# Altium project PCB_Smart_Climate_Monitor.PrjPcb
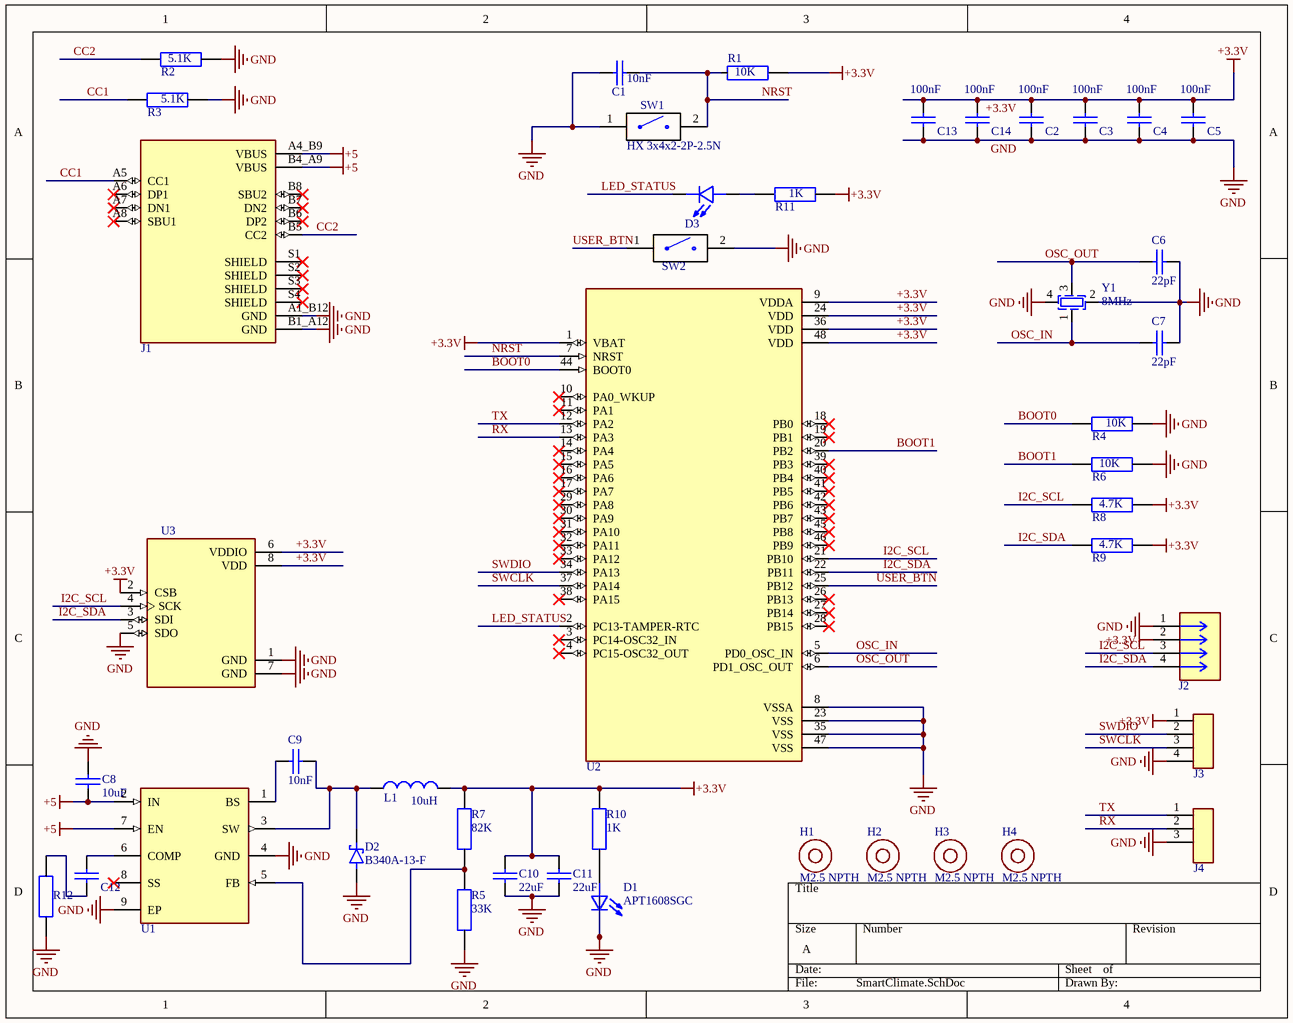
[diagram p0: SmartClimate.SchDoc]
Interface: I2C, UART, SWD; Layers: 2; Size: 50x35; V_IN: 5V or 3.7V
1 sheet, 44 parts. Net scope: global (net labels, ports and power ports of the same name join across sheets).
Board file: PCB1.PcbDoc

## Sheet SmartClimate.SchDoc
size A; SheetNumber: 1; SheetTotal: 1

### Parts
C1  10nF  [CAPC1608X95N]
C2  100nF  [CAPC1608X95N]
C3  100nF  [CAPC1608X95N]
C4  100nF  [CAPC1608X95N]
C5  100nF  [CAPC1608X95N]
C6  22pF  [CAPC1608X90]
C7  22pF  [CAPC1608X90]
C8  10uF  [CAPC2012X88N]
C9  10nF  [CAPC1608X95N]
C10  22uF  [CAPC2012X88N]
C11  22uF  [CAPC2012X88N]
C12  3.9nF  [CAPC1608X95N]  (value not drawn)
C13  100nF  [CAPC1608X95N]
C14  100nF  [CAPC1608X95N]
D1  APT1608SGC  [LED_APT1608SGC]
D2  B340A-13-F  [D_SMA_DO214AC]
D3  D_LED_Red_0603  [LED_APT1608SGC]  (value not drawn)
H1  M2.5 NPTH  [MH_M2_5_D2_7_NPTH]
H2  M2.5 NPTH  [MH_M2_5_D2_7_NPTH]
H3  M2.5 NPTH  [MH_M2_5_D2_7_NPTH]
H4  M2.5 NPTH  [MH_M2_5_D2_7_NPTH]
J1  J_USB-C_TYPE-C-31-M-12  [HRO_TYPE-C-31-M-12]  (value not drawn)
J2  J_SM04B-SRSS-TB  [CONN_SM04B-SRSS-TB_JST]  (value not drawn)
J3  J_Header_1x04_2.54mm_THT  [HDR_1x04_P2.54_THT]  (value not drawn)
J4  J_Header_1x03_2.54mm_THT  [HDR_1x03_P2.54_THT]  (value not drawn)
L1  10uH  [L_XGL5050]
R1  10K  [RESC1608X55N_10K]
R2  5.1K  [RESC1608X55N_10K]
R3  5.1K  [RESC1608X55N_10K]
R4  10K  [RESC1608X55N_10K]
R5  33K  [RESC1608X55N_10K]
R6  10K  [RESC1608X55N_10K]
R7  82K  [RESC1608X55N_10K]
R8  4.7K  [RESC1608X55N_10K]
R9  4.7K  [RESC1608X55N_10K]
R10  1K  [RESC1608X55N_10K]
R11  1K  [RESC1608X55N_10K]
R12  6.8K  [RESC1608X55N]  (value not drawn)
SW1  HX 3x4x2-2P-2.5N  [SW_HX_3x4x2_2P]
SW2  SW_SPST_3x4x2mm  [SW_HX_3x4x2_2P]  (value not drawn)
U1  U_MP2307DN-LF-Z  [SOIC127P600X170-9N]  (value not drawn)
U2  U_STM32F103C8T6  [QFP50P900X900X160-48N]  (value not drawn)
U3  U_BME280  [PSON65P250X250X100-8N]  (value not drawn)
Y1  8MHz  [XTAL_ECX32_3225_4P]

### Nets
+3.3V: C2.1 C3.1 C4.1 C5.1 C10.2 C11.2 C13.1 C14.1 J2.2 J3.1 L1.2 R1.1 R7.1 R8.1 R9.1 R10.1 R11.2 U2.1(VBAT) U2.9(VDDA) U2.24(VDD) U2.36(VDD) U2.48(VDD) U3.2(CSB) U3.6(VDDIO) U3.8(VDD)
+5: C8.1 J1.A4_B9(VBUS) J1.B4_A9(VBUS) U1.2(IN) U1.7(EN)
GND: C1.1 C2.2 C3.2 C4.2 C5.2 C6.2 C7.1 C8.2 C10.1 C11.1 C13.2 C14.2 D1.1(C) D2.2(A) J1.A1_B12(GND) J1.B1_A12(GND) J2.1 J3.4 J4.3 R2.2 R3.2 R4.2 R5.2 R6.2 R12.1 SW1.1 SW2.2 U1.4(GND) U1.9(EP) U2.8(VSSA) U2.23(VSS) U2.35(VSS) U2.47(VSS) U3.1(GND) U3.5(SDO) U3.7(GND) Y1.2 Y1.4
BOOT0: R4.1 U2.44(BOOT0)
BOOT1: R6.1 U2.20(PB2)
CC1: J1.A5(CC1) R3.1
CC2: J1.B5(CC2) R2.1
I2C_SCL: J2.3 R8.2 U2.21(PB10) U3.4(SCK)
I2C_SDA: J2.4 R9.2 U2.22(PB11) U3.3(SDI)
LED_STATUS: D3.1(C) U2.2(PC13-TAMPER-RTC)
NRST: C1.2 R1.2 SW1.2 U2.7(NRST)
OSC_IN: C7.2 U2.5(PD0_OSC_IN) Y1.1
OSC_OUT: C6.1 U2.6(PD1_OSC_OUT) Y1.3
RX: J4.2 U2.13(PA3)
SWCLK: J3.3 U2.37(PA14)
SWDIO: J3.2 U2.34(PA13)
TX: J4.1 U2.12(PA2)
USER_BTN: SW2.1 U2.25(PB12)
NetC9_1: C9.1 D2.1(K) L1.1 U1.3(SW)
NetC9_2: C9.2 U1.1(BS)
NetC12_1: C12.1 R12.2
NetC12_2: C12.2 U1.6(COMP)
NetD1_2: D1.2(A) R10.2
NetD3_2: D3.2(A) R11.1
NetR5_1: R5.1 R7.2 U1.5(FB)

Not connected (* = marked no-connect by the designer): J1 A6(DP1)* A7(DN1)* A8(SBU1)* B6(DP2)* B7(DN2)* B8(SBU2)* S1(SHIELD)* S2(SHIELD)* S3(SHIELD)* S4(SHIELD)*; U1 8(SS)*; U2 3(PC14-OSC32_IN)* 4(PC15-OSC32_OUT)* 10(PA0_WKUP)* 11(PA1)* 14(PA4)* 15(PA5)* 16(PA6)* 17(PA7)* 18(PB0)* 19(PB1)* 26(PB13)* 27(PB14)* 28(PB15)* 29(PA8)* 30(PA9)* 31(PA10)* 32(PA11)* 33(PA12)* 38(PA15)* 39(PB3)* 40(PB4)* 41(PB5)* 42(PB6)* 43(PB7)* 45(PB8)* 46(PB9)*

### Library data of the parts
C1 C9 = C_10nF_5%_50V_0603: 10nF +/-5% 50V X7R ceramic capacitor 0603; BOM References: C3; Tolerance: 5%; MP: C0603X103J5RECAUTO; MF: KEMET; Value: 10nF; Package: 0603; Capacitance: 10nF; Voltage: 50V; Dielectric: X7R; Datasheet: https://search.kemet.com/component-documentation/download/specsheet/C0603X103J5RECAUTO
C2-C5 C13 C14 = C_100nF_10%_16V_0603: 100nF +/-10% 16V X7R ceramic capacitor 0603; BOM References: C4-C8; Tolerance: 10%; MP: C0603C104K4RACTU; MF: KEMET; Value: 100nF; Package: 0603; Capacitance: 100nF; Voltage: 16V; Dielectric: X7R; Datasheet: https://search.kemet.com/component-documentation/download/specsheet/C0603C104K4RACTU
C6 C7 = C_22pF_2%_50V_0603: 22pF +/-2% 50V C0G ceramic capacitor 0603; BOM References: C9,C10; Tolerance: 2%; MP: CC0603GRNPO9BN220; MF: Yageo; Value: 22pF; Package: 0603; Capacitance: 22pF; Voltage: 50V; Dielectric: C0G; Datasheet: https://www.yageogroup.com/component-documentation/download/specsheet/CC0603GRNPO9BN220
C8 = C_10uF_10%_25V_0805: 10uF +/-10% 25V X5R ceramic capacitor 0805; BOM References: C1,C2; Tolerance: 10%; MP: C0805C106K3PACTU; MF: KEMET; Value: 10uF; Package: 0805; Capacitance: 10uF; Voltage: 25V; Dielectric: X5R; Datasheet: https://search.kemet.com/component-documentation/download/specsheet/C0805C106K3PACTU
C10 C11 = C_22uF_20%_10V_0805: 22uF 20% 10V X5R ceramic capacitor 0805; MP: C2012X5R1A226M125AB; MF: TDK; Value: 22uF; Package: 0805; Capacitance: 22uF; Tolerance: 20%; Voltage: 10V; Dielectric: X5R; Datasheet: https://product.tdk.com/en/search/capacitor/ceramic/mlcc/info?part_no=C2012X5R1A226M125AB
C12 = C_3n9_5%_50V_0603: 3.9nF 5% 50V C0G ceramic capacitor 0603; MP: C1608C0G1H392J080AA; MF: TDK; Value: 3.9nF; Package: 0603; Capacitance: 3.9nF; Tolerance: 5%; Voltage: 50V; Dielectric: C0G; Datasheet: https://product.tdk.com/en/search/capacitor/ceramic/mlcc/info?part_no=C1608C0G1H392J080AA
D1 = D_LED_Green_0603: Green LED, 0603 (1608 metric); BOM References: LED1; MF: Kingbright; Value: APT1608SGC; Package: 0603 (1608 Metric); MP: APT1608SGC; Color: Green; Datasheet: https://www.kingbrightusa.com/images/catalog/spec/APT1608SGC.pdf
D2 = D_Schottky_40V_3A_SMA: B340A-13-F Schottky rectifier, 40V 3A, SMA DO-214AC; cathode pin1, anode pin2; BOM References: D1; MF: Diodes Incorporated; Value: B340A-13-F; Package: SMA DO-214AC; MP: B340A-13-F; Voltage: 40V; Current: 3A; Datasheet: https://www.diodes.com/part/view/B340A
D3 = D_LED_Red_0603: Red LED, 0603 (1608 metric); Value: APT1608SURCK; BOM References: LED2,LED3; MF: Kingbright; Package: 0603 (1608 Metric); MP: APT1608SURCK; Color: Red; Datasheet: https://www.kingbrightusa.com/images/catalog/spec/apt1608surck.pdf
H1-H4 = H_MountingHole_M2_5_NPTH: Mechanical mounting hole M2.5, 2.7mm NPTH; Screw head clearance: 5.5 mm; Mechanical 15 outline; Hole diameter: 2.7 mm
J1 = J_USB-C_TYPE-C-31-M-12: TYPE-C-31-M-12 USB Type-C USB2.0 receptacle, 16 contacts; BOM References: J1; MF: Korean Hroparts Elec; Value: TYPE-C-31-M-12; Package: SMD top mount; MP: TYPE-C-31-M-12; LCSC: C165948; Datasheet: https://datasheet.lcsc.com/lcsc/1903211732_Korean-Hroparts-Elec-TYPE-C-31-M-12_C165948.pdf
J2 = J_SM04B-SRSS-TB: JST SH 4-position 1.0mm right-angle side-entry SMT connector; BOM References: J2; Value: SM04B-SRSS-TB; Package: JST SH 1x4 1.0mm SMT; MP: SM04B-SRSS-TB; MF: JST; Pitch: 1.0mm; Datasheet: https://www.jst-mfg.com/product/pdf/eng/eSH.pdf
J3 = J_Header_1x04_2.54mm_THT: Pin header 1x4, 2.54mm pitch, vertical through hole; Value: TSW-104-07-G-S; BOM References: J3; MF: Samtec; Package: 1x4 P2.54 THT; Pitch: 2.54mm; MP: TSW-104-07-G-S; Number of Pins: 4; Datasheet: https://suddendocs.samtec.com/prints/tsw-xxx-xx-x-x-xx-xxx-footprint.pdf
J4 = J_Header_1x03_2.54mm_THT: Pin header 1x3, 2.54mm pitch, vertical through hole; Value: TSW-103-07-G-S; BOM References: J4; MF: Samtec; Package: 1x3 P2.54 THT; Pitch: 2.54mm; MP: TSW-103-07-G-S; Number of Pins: 3; Datasheet: https://suddendocs.samtec.com/prints/tsw-xxx-xx-x-x-xx-xxx-footprint.pdf
L1 = L_10uH_20%_2.5A_XGL5050: 10uH +/-20% shielded inductor, Isat 2.5A at 10% drop, DCR 33.6mOhm max, Coilcraft XGL5050; BOM References: L1; Tolerance: 20%; Saturation Current Requirement: >=2A; DC Resistance Requirement: <50mOhm; MP: XGL5050-103MEC; Saturation Current: 2.5A at 10% drop; 3.7A at 20% drop; Rated Current: 4.6A at 20C rise; Value: 10uH; Package: 5.28x5.48x5.10mm max height; Inductance: 10uH; MF: Coilcraft; DC Resistance: 33.6mOhm max; Datasheet: https://www.coilcraft.com/getmedia/348b2df6-54b3-4579-8737-e8367b6fa367/xgl5050.pdf
R1 R4 R6 = R_10k_1%_1/10W_0603: 10k Ohms +/-1% 0.1W, 1/10W Chip Resistor 0603 (1608 Metric) Thick Film; BOM References: R10; Tolerance: 1%; MP: RC0603FR-0710KL; MF: Yageo; Value: 10K; Package: 0603 (1608 Metric); Resistance: 10k; Power: 0.1W; Technology: Thick Film; Datasheet: https://www.yageo.com/upload/media/product/productsearch/datasheet/rchip/PYu-RC_Group_51_RoHS_L_12.pdf
R2 R3 = R_5k1_1%_1/10W_0603: 5k1 Ohms +/-1% 0.1W, 1/10W Chip Resistor 0603 (1608 Metric) Thick Film; BOM References: R1,R2; Tolerance: 1%; MP: RC0603FR-075K1L; MF: Yageo; Value: 5.1K; Package: 0603 (1608 Metric); Resistance: 5k1; Power: 0.1W; Technology: Thick Film; Datasheet: https://www.yageo.com/upload/media/product/productsearch/datasheet/rchip/PYu-RC_Group_51_RoHS_L_12.pdf
R5 = R_33k_1%_1/10W_0603: 33k Ohms +/-1% 0.1W, 1/10W Chip Resistor 0603 (1608 Metric) Thick Film; BOM References: R6; Tolerance: 1%; MP: RC0603FR-0733KL; MF: Yageo; Value: 33K; Package: 0603 (1608 Metric); Resistance: 33k; Power: 0.1W; Technology: Thick Film; Datasheet: https://www.yageo.com/upload/media/product/productsearch/datasheet/rchip/PYu-RC_Group_51_RoHS_L_12.pdf
R7 = R_82k_1%_1/10W_0603: 82k Ohms +/-1% 0.1W, 1/10W Chip Resistor 0603 (1608 Metric) Thick Film; BOM References: R5; Tolerance: 1%; MP: RC0603FR-0782KL; MF: Yageo; Value: 82K; Package: 0603 (1608 Metric); Resistance: 82k; Power: 0.1W; Technology: Thick Film; Datasheet: https://www.yageo.com/upload/media/product/productsearch/datasheet/rchip/PYu-RC_Group_51_RoHS_L_12.pdf
R8 R9 = R_4k7_1%_1/10W_0603: 4k7 Ohms +/-1% 0.1W, 1/10W Chip Resistor 0603 (1608 Metric) Thick Film; BOM References: R3,R4; Tolerance: 1%; MP: RC0603FR-074K7L; MF: Yageo; Value: 4.7K; Package: 0603 (1608 Metric); Resistance: 4k7; Power: 0.1W; Technology: Thick Film; Datasheet: https://www.yageo.com/upload/media/product/productsearch/datasheet/rchip/PYu-RC_Group_51_RoHS_L_12.pdf
R10 R11 = R_1k_5%_1/10W_0603: 1k Ohms +/-5% 0.1W, 1/10W Chip Resistor 0603 (1608 Metric) Thick Film; BOM References: R7-R9; Tolerance: 5%; MP: RC0603JR-071KL; MF: Yageo; Value: 1K; Package: 0603 (1608 Metric); Resistance: 1k; Power: 0.1W; Technology: Thick Film; Datasheet: https://www.yageo.com/upload/media/product/productsearch/datasheet/rchip/PYu-RC_Group_51_RoHS_L_12.pdf
R12 = R_6k8_1%_1/10W_0603: 6.8kOhm 1% 0.1W thick film resistor 0603; Resistance: 6k8; MP: RC0603FR-076K8L; MF: Yageo; Value: 6.8K; Package: 0603 (1608 Metric); Tolerance: 1%; Power: 0.1W; Technology: Thick Film; Datasheet: https://www.yageogroup.com/component-documentation/download/specsheet/RC0603FR-076K8L
SW1 SW2 = SW_SPST_3x4x2mm: Hanxia HX 3x4x2-2P-2.5N tactile switch, SPST-NO, 50mA 12V, 4x3x2mm; BOM References: SW1,SW2; Operating Force: 2.5N; Value: HX 3x4x2-2P-2.5N; Package: 3x4x2mm; MP: HX 3x4x2-2P-2.5N; MF: Hanxia; Configuration: SPST-NO; LCSC: C36498961; Voltage: 12V; Current: 50mA; Datasheet: https://atta.szlcsc.com/upload/public/pdf/source/20250707/B47B221526B87D575FBEDE6D3B809220.pdf
U1 = U_MP2307DN-LF-Z: MP2307DN-LF-Z 3A, 23V, 340kHz step-down DC-DC regulator, SOIC-8-EP; BOM References: U2; MF: Monolithic Power Systems; Value: 340kHz; Package: SOIC-8-EP; MP: MP2307DN-LF-Z; Current: 3A; Voltage: 23V; Frequency: 340kHz; Datasheet: https://www.monolithicpower.com/en/mp2307.html
U2 = U_STM32F103C8T6: STM32F103C8T6 32-bit Cortex-M3 MCU, 64KB Flash, 72MHz, LQFP-48 7x7mm; BOM References: U1; MF: STMicroelectronics; Value: 72MHz; Package: LQFP-48 (7x7mm); MP: STM32F103C8T6; Flash: 64KB; Frequency: 72MHz; Datasheet: https://www.st.com/resource/en/datasheet/stm32f103c8.pdf
U3 = U_BME280: BME280 temperature, humidity and pressure sensor, LGA-8 2.5x2.5mm; BOM References: U3; MF: Bosch; Value: BME280; Package: LGA-8 (2.5x2.5mm); MP: BME280; Datasheet: https://www.bosch-sensortec.com/media/boschsensortec/downloads/datasheets/bst-bme280-ds002.pdf
Y1 = Y_8MHz_20pF_3225: ECS-80-20-33-JEN-TR3 8MHz quartz crystal, CL20pF, +/-20ppm, 3225 4-pad; BOM References: X1; Load Capacitance: 20pF; MF: ECS Inc.; Frequency Stability: +/-50ppm; Value: 8MHz; Package: 3225 4-pad; Frequency: 8MHz; Frequency Tolerance: +/-20ppm; MP: ECS-80-20-33-JEN-TR3; Datasheet: https://ecsxtal.com/store/pdf/ecx-32.pdf